# Altium schematic sheet 07_KOM_ACB23_4009_ComputeModule.SchDoc: ComputeModule
size A4; DocumentNumber: 2023-03-28; Revision: v0.11; SheetNumber: 7; SheetTotal: 9
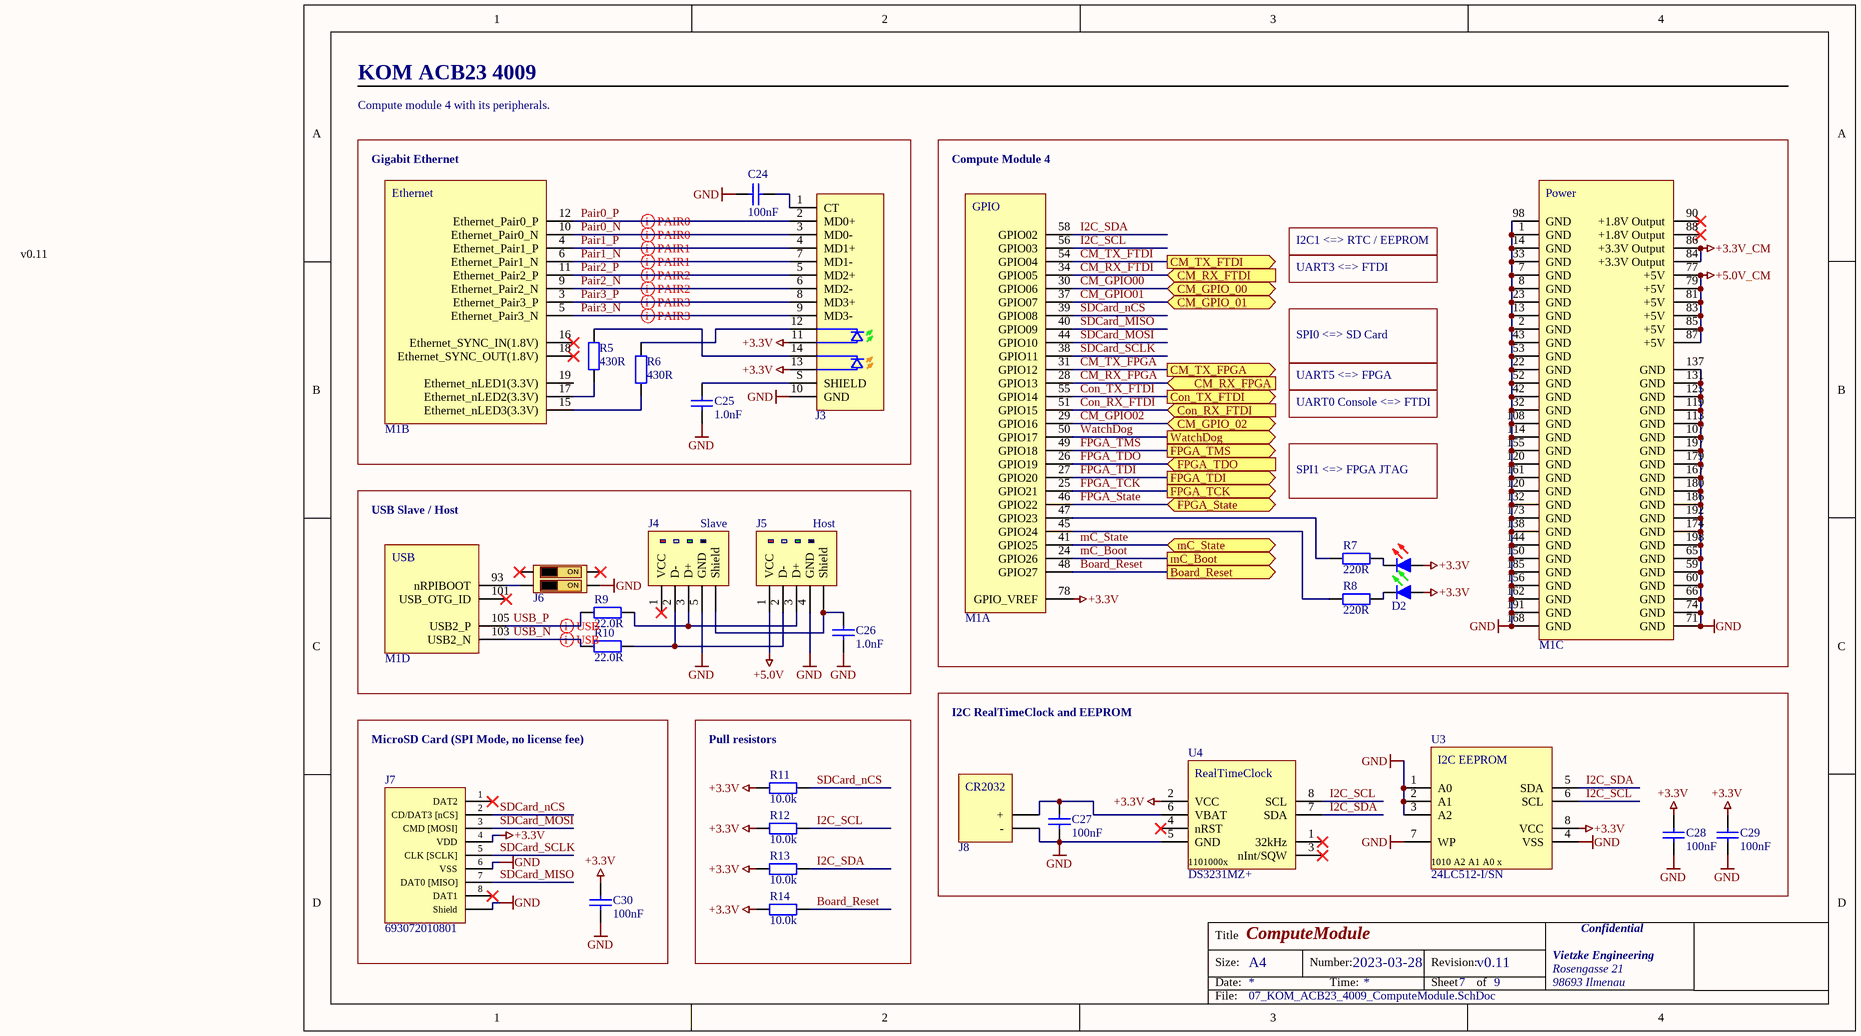
[diagram p0: 07_KOM_ACB23_4009_ComputeModule.SchDoc]

## Parts
C24  value 100nF  [C0402]  (hidden comment: C0402C104K3RACTU)
C25  value 1.0nF  [C1206]  (hidden comment: CC1206KKX7RSBB102)
C26  value 1.0nF  [C1206]  (hidden comment: CC1206KKX7RSBB102)
C27  value 100nF  [C0402]  (hidden comment: C0402C104K3RACTU)
C28  value 100nF  [C0402]  (hidden comment: C0402C104K3RACTU)
C29  value 100nF  [C0402]  (hidden comment: C0402C104K3RACTU)
C30  value 100nF  [C0402]  (hidden comment: C0402C104K3RACTU)
D2  LTST-C195KGJRKT  [SMD LED 0606 DUAL GREEN RED]  (value not drawn)
J3  93626-3006  [93626-3508]  (value not drawn)
J4  651005136421  [USB MiniUSB B Vertical THT]  (value not drawn)
J5  614004135023  [614004135023]  (value not drawn)
J6  416131160802  [416131160802]  (value not drawn)
J7  693072010801  [693072010801]
J8  1060TR  [1060TR]  (value not drawn)
M1  RaspberryPi Compute Module 4  [RaspberryComputeModule4]  (value not drawn)  (parts A,B,C,D of 10)
R5  value 430R  [R0402]  (hidden comment: RC0402FR-07430RL)
R6  value 430R  [R0402]  (hidden comment: RC0402FR-07430RL)
R7  value 220R  [R0402]  (hidden comment: RC0402FR-07220RL)
R8  value 220R  [R0402]  (hidden comment: RC0402FR-07220RL)
R9  value 22.0R  [R0402]  (hidden comment: RC0402FR-0722RL)
R10  value 22.0R  [R0402]  (hidden comment: RC0402FR-0722RL)
R11  value 10.0k  [R0402]  (hidden comment: RC0402FR-0710KL)
R12  value 10.0k  [R0402]  (hidden comment: RC0402FR-0710KL)
R13  value 10.0k  [R0402]  (hidden comment: RC0402FR-0710KL)
R14  value 10.0k  [R0402]  (hidden comment: RC0402FR-0710KL)
U3  24LC512-I/SN  [soic-8]
U4  DS3231MZ+  [SOIC-8]

## Blocks framed on the sheet
Gigabit Ethernet: C24 C25 J3 M1 R5 R6
MicroSD Card (SPI Mode, no license fee): C30 J7
Pull resistors: R11-R14
I2C RealTimeClock and EEPROM: C27-C29 J8 U3 U4

## Ports
Board_Reset (out), CM_GPIO_00 (bidir), CM_GPIO_01 (bidir), CM_GPIO_02 (bidir), CM_RX_FPGA (in), CM_RX_FTDI (in), CM_TX_FPGA (out), CM_TX_FTDI (out), Con_RX_FTDI (in), Con_TX_FTDI (out), FPGA_State (bidir), FPGA_TCK (out), FPGA_TDI (out), FPGA_TDO (in), FPGA_TMS (out), mC_Boot (out), mC_State (bidir), WatchDog (out)

## Nets
+3.3V: C28.2 C29.2 C30.2 D2.1(AG) D2.2(AR) J3.11(GA) J3.13(YA) J7.4(VDD) M1.78(GPIO_VREF) R11.1 R12.1 R13.1 R14.1 U3.8(VCC) U4.2(VCC)
+3.3V_CM: M1.84(+3.3V_Output) M1.86(+3.3V_Output)
+5.0V: J5.1(VCC)
+5.0V_CM: M1.77(+5V) M1.79(+5V) M1.81(+5V) M1.83(+5V) M1.85(+5V) M1.87(+5V)
GND: C24.2 C25.1 C26.2 C27.1 C28.1 C29.1 C30.1 J3.10(GND) J4.5(GND) J5.4(GND) J6.R2 J7.6(VSS) J7.Shield J8.- M1.1(GND) M1.2(GND) M1.7(GND) M1.8(GND) M1.13(GND) M1.14(GND) M1.22(GND) M1.23(GND) M1.32(GND) M1.33(GND) M1.42(GND) M1.43(GND) M1.52(GND) M1.53(GND) M1.59(GND) M1.60(GND) M1.65(GND) M1.66(GND) M1.71(GND) M1.74(GND) M1.98(GND) M1.107(GND) M1.108(GND) M1.113(GND) M1.114(GND) M1.119(GND) M1.120(GND) M1.125(GND) M1.131(GND) M1.132(GND) M1.137(GND) M1.138(GND) M1.144(GND) M1.150(GND) M1.155(GND) M1.156(GND) M1.161(GND) M1.162(GND) M1.167(GND) M1.168(GND) M1.173(GND) M1.174(GND) M1.179(GND) M1.180(GND) M1.185(GND) M1.186(GND) M1.191(GND) M1.192(GND) M1.197(GND) M1.198(GND) U3.1(A0) U3.2(A1) U3.3(A2) U3.4(VSS) U3.7(WP) U4.5(GND)
Board_Reset: M1.48(GPIO27) R14.2 ; port Board_Reset
CM_GPIO00: M1.30(GPIO06) ; port CM_GPIO_00
CM_GPIO01: M1.37(GPIO07) ; port CM_GPIO_01
CM_GPIO02: M1.29(GPIO16) ; port CM_GPIO_02
CM_RX_FPGA: M1.28(GPIO13) ; port CM_RX_FPGA
CM_RX_FTDI: M1.34(GPIO05) ; port CM_RX_FTDI
CM_TX_FPGA: M1.31(GPIO12) ; port CM_TX_FPGA
CM_TX_FTDI: M1.54(GPIO04) ; port CM_TX_FTDI
Con_RX_FTDI: M1.51(GPIO15) ; port Con_RX_FTDI
Con_TX_FTDI: M1.55(GPIO14) ; port Con_TX_FTDI
FPGA_State: M1.46(GPIO22) ; port FPGA_State
FPGA_TCK: M1.25(GPIO21) ; port FPGA_TCK
FPGA_TDI: M1.27(GPIO20) ; port FPGA_TDI
FPGA_TDO: M1.26(GPIO19) ; port FPGA_TDO
FPGA_TMS: M1.49(GPIO18) ; port FPGA_TMS
I2C_SCL: M1.56(GPIO03) R12.2 U3.6(SCL) U4.8(SCL)
I2C_SDA: M1.58(GPIO02) R13.2 U3.5(SDA) U4.7(SDA)
mC_Boot: M1.24(GPIO26) ; port mC_Boot
mC_State: M1.41(GPIO25) ; port mC_State
Pair0_N: J3.3(MD0-) M1.10(Ethernet_Pair0_N)
Pair0_P: J3.2(MD0+) M1.12(Ethernet_Pair0_P)
Pair1_N: J3.7(MD1-) M1.6(Ethernet_Pair1_N)
Pair1_P: J3.4(MD1+) M1.4(Ethernet_Pair1_P)
Pair2_N: J3.6(MD2-) M1.9(Ethernet_Pair2_N)
Pair2_P: J3.5(MD2+) M1.11(Ethernet_Pair2_P)
Pair3_N: J3.9(MD3-) M1.5(Ethernet_Pair3_N)
Pair3_P: J3.8(MD3+) M1.3(Ethernet_Pair3_P)
SDCard_MISO: J7.7(DAT0_[MISO]) M1.40(GPIO09)
SDCard_MOSI: J7.3(CMD_[MOSI]) M1.44(GPIO10)
SDCard_nCS: J7.2(CD/DAT3_[nCS]) M1.39(GPIO08) R11.2
SDCard_SCLK: J7.5(CLK_[SCLK]) M1.38(GPIO11)
USB_N: M1.103(USB2_N) R10.1
USB_P: M1.105(USB2_P) R9.1
WatchDog: M1.50(GPIO17) ; port WatchDog
NetC24_1: C24.1 J3.1(CT)
NetC25_2: C25.2 J3.S(SHIELD)
NetC26_1: C26.1 J4.S(Shield) J5.S(Shield)
NetC27_2: C27.2 J8.+ U4.6(VBAT)
NetD2_3: D2.3(KG) R8.2
NetD2_4: D2.4(KR) R7.2
NetJ3_12: J3.12 R6.2
NetJ3_14: J3.14(YK) R5.2
NetJ4_2: J4.2(D-) J5.2(D-) R10.2
NetJ4_3: J4.3(D+) J5.3(D+) R9.2
NetJ6_L2: J6.L2 M1.93(nRPIBOOT)
NetM1_15: M1.15(Ethernet_nLED3(3.3V)) R6.1
NetM1_17: M1.17(Ethernet_nLED2(3.3V)) R5.1
NetM1_45: M1.45(GPIO24) R8.1
NetM1_47: M1.47(GPIO23) R7.1

Not connected (* = marked no-connect by the designer): J4 1(VCC)*; J6 L1* R1*; J7 1(DAT2)* 8(DAT1)*; M1 16(Ethernet_SYNC_IN(1.8V))* 18(Ethernet_SYNC_OUT(1.8V))* 19(Ethernet_nLED1(3.3V)) 88(+1.8V_Output)* 90(+1.8V_Output)* 101(USB_OTG_ID)*; U4 1(32kHz)* 3(nInt/SQW)* 4(nRST)*

## Layout directives
differential pair: Pair0_N, Pair0_P, Pair1_N, Pair1_P, Pair2_N, Pair2_P, Pair3_N, Pair3_P, USB_N, USB_P

## Notes on the sheet
- KOM ACB23 4009
- Compute module 4 with its peripherals.
- Compute Module 4
- I2C1 <=> RTC / EEPROM
- v0.11
- UART3 <=> FTDI
- UART5 <=> FPGA
- SPI0 <=> SD Card
- UART0 Console <=> FTDI
- USB Slave / Host
- SPI1 <=> FPGA JTAG
- Slave
- Host
- Title
- Size:
- Date:
- A4
- Number:
- Time:
- Revision:
- Sheet
- of
- Vietzke Engineering
- Rosengasse 21
- 98693 Ilmenau
- Confidential
- File:
- (in symbol 24LC512-I/SN) I2C EEPROM; 1010 A2 A1 A0 x
- (in symbol 1060TR) CR2032
- (in symbol 416131160802) ON
- (in symbol DS3231MZ+) RealTimeClock; 1101000x
- (in symbol RaspberryPi Compute Module 4, part A) GPIO
- (in symbol RaspberryPi Compute Module 4, part B) Ethernet
- (in symbol RaspberryPi Compute Module 4, part C) Power
- (in symbol RaspberryPi Compute Module 4, part D) USB

## Library data of the parts
C24 C27-C30 = C0402C104K3RACTU: 0402 100nF 25.0V; Type: SMD; Package: 0402; Supplier 1: Mouser; Supplier Part Number 1: 80-C0402C104K3R
C25 C26 = CC1206KKX7RSBB102: 1206 1nF 2.5kV; Type: SMD; Package: 1206; Supplier 1: Mouser; Supplier Part Number 1: 603-CC1206KKX7RSBB10
D2 = LTST-C195KGJRKT: SMD LED 0606 Dual RED GREEN; Type: SMD; Package: 0603; Supplier 1: Mouser; Supplier Part Number 1: 859-LTST-C195KGJRKT
J3 = 93626-3006: RJ45 MagJack 1Gbit; Type: THT; Package: -; Supplier 1: Mouser; Supplier Part Number 1: 538-93626-3006
J4 = 651005136421: MiniUSB B Female Vertical THT; Type: THT; Supplier 1: Mouser; Supplier Part Number 1: 710-651005136421
J5 = 614004135023: USB A Female Vertical THT; Type: THT; Package: -; Supplier 1: Mouser; Supplier Part Number 1: 710-614004135023; Supplier 2: Digi-Key; Supplier Part Number 2: 732-2732-ND
J6 = 416131160802: DIP switch SMD 2P; Type: SMD; Supplier 1: Mouser; Supplier Part Number 1: 710-416131160802
J7 = 693072010801: WR-CRD Micro SD Card Connector; Type: SMD; Supplier 1: Mouser; Supplier Part Number 1: 710-693072010801
J8 = 1060TR: Knopfzellen-Batteriehalter SMD; Type: SMD; Package: -; Supplier 1: Mouser; Supplier Part Number 1: 534-1060TR
M1 = RaspberryPi Compute Module 4: Compute Module 4 Socket; Type: SMD; Package: -; Supplier 1: Mouser; Supplier Part Number 1: 798-DF40C100DS0.4V51
R5 R6 = RC0402FR-07430RL: 0402 430R; Type: SMD; Package: 0402; Supplier 1: Mouser; Supplier Part Number 1: 603-RC0402FR-07430RL
R7 R8 = RC0402FR-07220RL: 0402 220R; Type: SMD; Package: 0402; Supplier 1: Mouser; Supplier Part Number 1: 603-RC0402FR-07220RL
R9 R10 = RC0402FR-0722RL: 0402 22.0R; Type: SMD; Package: 0402; Supplier 1: Mouser; Supplier Part Number 1: 603-RC0402FR-0722RL
R11-R14 = RC0402FR-0710KL: 0402 10.0K; Type: SMD; Package: 0402; Supplier 1: Mouser; Supplier Part Number 1: 603-RC0402FR-0710KL
U3 = 24LC512-I/SN: I2C EEPROM with 64kBit Memory; Type: SMD; Package: SOIC-8; Supplier 1: Mouser; Supplier Part Number 1: 579-24LC512-I/SN
U4 = DS3231MZ+: Extremely Accurate I2C-IntegratedRTC/TCXO/Crystal; Type: SMD; Supplier 1: Mouser; Supplier Part Number 1: 700-DS3231MZ+